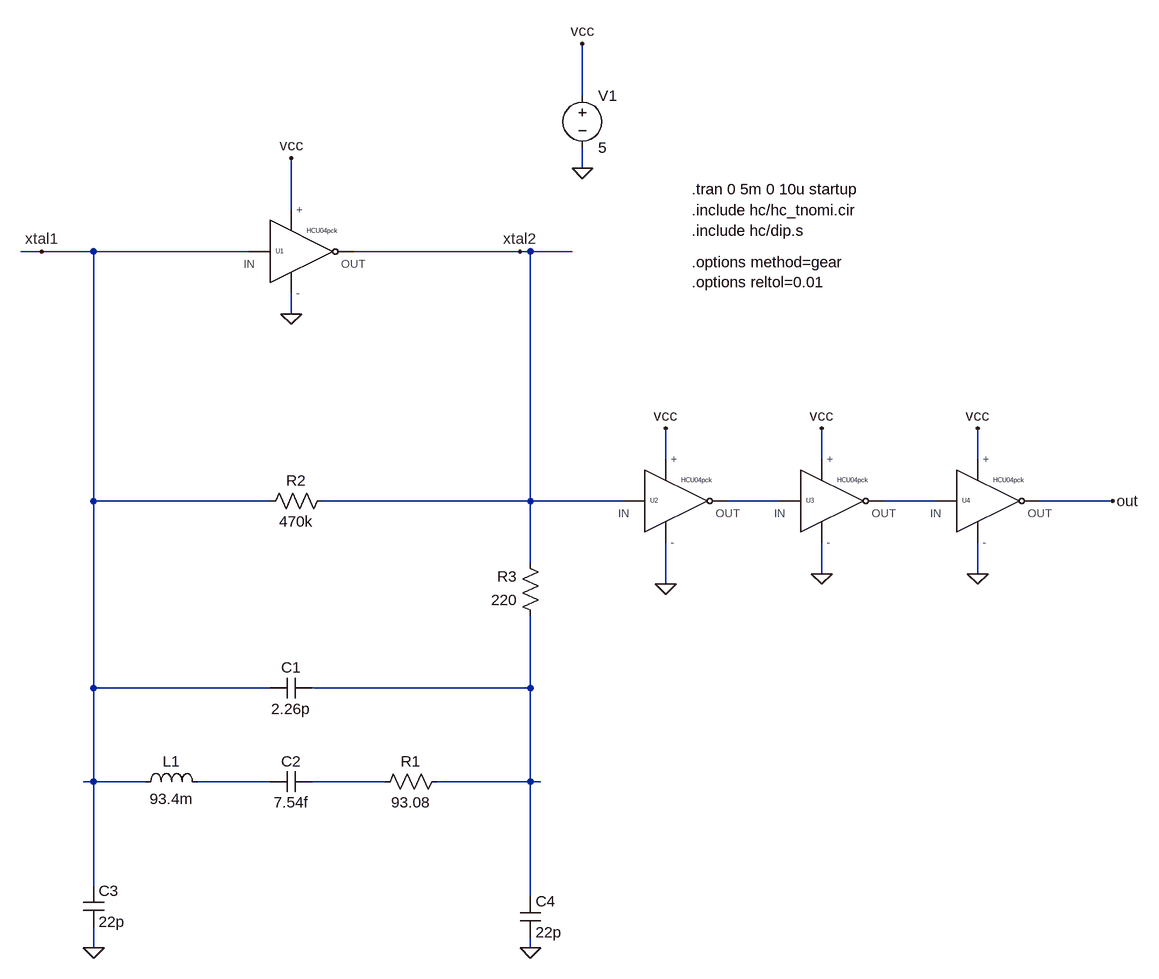
[diagram p0: schematic osc_hc04.asc]
osc_hc04.asc, the LTspice schematic file:
Version 4.1
SHEET 1 888 980
WIRE 16 -352 16 -432
WIRE 16 -240 16 -272
WIRE -432 -176 -432 -256
WIRE -816 -112 -848 -112
WIRE -736 -112 -816 -112
WIRE -496 -112 -736 -112
WIRE -80 -112 -336 -112
WIRE -64 -112 -80 -112
WIRE 0 -112 -64 -112
WIRE -432 -16 -432 -48
WIRE 144 208 144 160
WIRE 384 208 384 160
WIRE 624 208 624 160
WIRE -736 272 -736 -112
WIRE -464 272 -736 272
WIRE -64 272 -64 -112
WIRE -64 272 -384 272
WIRE 80 272 -64 272
WIRE 320 272 240 272
WIRE 560 272 480 272
WIRE 832 272 720 272
WIRE -64 368 -64 272
WIRE 384 384 384 336
WIRE 624 384 624 336
WIRE 144 400 144 336
WIRE -736 560 -736 272
WIRE -464 560 -736 560
WIRE -64 560 -64 448
WIRE -64 560 -400 560
WIRE -736 704 -736 560
WIRE -736 704 -752 704
WIRE -656 704 -736 704
WIRE -464 704 -576 704
WIRE -288 704 -400 704
WIRE -64 704 -64 560
WIRE -64 704 -208 704
WIRE -48 704 -64 704
WIRE -736 864 -736 704
WIRE -64 880 -64 704
WIRE -736 960 -736 928
WIRE -64 960 -64 944
FLAG -736 960 0
FLAG -64 960 0
FLAG 16 -240 0
FLAG -816 -112 xtal1
FLAG -80 -112 xtal2
FLAG 144 400 0
FLAG 384 384 0
FLAG 624 384 0
FLAG 16 -432 vcc
FLAG -432 -256 vcc
FLAG -432 -16 0
FLAG 144 160 vcc
FLAG 384 160 vcc
FLAG 624 160 vcc
FLAG 832 272 out
SYMBOL cap -400 544 R90
WINDOW 0 0 32 VBottom 2
WINDOW 3 32 32 VTop 2
SYMATTR InstName C1
SYMATTR Value 2.26p
SYMBOL res -192 688 R90
WINDOW 0 0 56 VBottom 2
WINDOW 3 32 56 VTop 2
SYMATTR InstName R1
SYMATTR Value 93.08
SYMBOL cap -400 688 R90
WINDOW 0 0 32 VBottom 2
WINDOW 3 32 32 VTop 2
SYMATTR InstName C2
SYMATTR Value 7.54f
SYMBOL ind -672 720 R270
WINDOW 0 32 56 VTop 2
WINDOW 3 5 56 VBottom 2
SYMATTR InstName L1
SYMATTR Value 93.4m
SYMATTR SpiceLine Rser=1m
SYMBOL cap -752 864 R0
SYMATTR InstName C3
SYMATTR Value 22p
SYMBOL cap -80 880 R0
SYMATTR InstName C4
SYMATTR Value 22p
SYMBOL voltage 16 -368 R0
WINDOW 123 0 0 Left 0
WINDOW 39 0 0 Left 0
SYMATTR InstName V1
SYMATTR Value 5
SYMBOL res -368 256 R90
WINDOW 0 0 56 VBottom 2
WINDOW 3 32 56 VTop 2
SYMATTR InstName R2
SYMATTR Value 470k
SYMBOL res -48 464 R180
WINDOW 0 36 76 Left 2
WINDOW 3 36 40 Left 2
SYMATTR InstName R3
SYMATTR Value 220
SYMBOL inv -464 -112 R0
WINDOW 3 56 -32 Left 0
SYMATTR InstName U1
SYMATTR Value HCU04pck
SYMBOL inv 112 272 R0
WINDOW 3 56 -32 Left 0
SYMATTR InstName U2
SYMATTR Value HCU04pck
SYMBOL inv 352 272 R0
WINDOW 3 56 -32 Left 0
SYMATTR InstName U3
SYMATTR Value HCU04pck
SYMBOL inv 592 272 R0
WINDOW 3 56 -32 Left 0
SYMATTR InstName U4
SYMATTR Value HCU04pck
TEXT 184 -208 Left 2 !.tran 0 5m 0 10u startup
TEXT 184 -176 Left 2 !.include hc/hc_tnomi.cir
TEXT 184 -144 Left 2 !.include hc/dip.s
TEXT 184 -96 Left 2 !.options method=gear\n.options reltol=0.01

The netlist it stands for:
* osc_hc04.asc
C1 N003 xtal1 2.26p
R1 N003 N005 93.08
C2 N005 N004 7.54f
L1 xtal1 N004 93.4m Rser=1m
C3 xtal1 0 22p
C4 N003 0 22p
V1 vcc 0 5
R2 xtal2 xtal1 470k
R3 N003 xtal2 220
X§U1 0 vcc xtal1 xtal2 HCU04pck  ; pins - + IN OUT
X§U2 0 vcc xtal2 N001 HCU04pck  ; pins - + IN OUT
X§U3 0 vcc N001 N002 HCU04pck  ; pins - + IN OUT
X§U4 0 vcc N002 out HCU04pck  ; pins - + IN OUT
.tran 0 5m 0 10u startup
.include hc/hc_tnomi.cir
.include hc/dip.s
.options method=gear
.options reltol=0.01
.backanno
.end